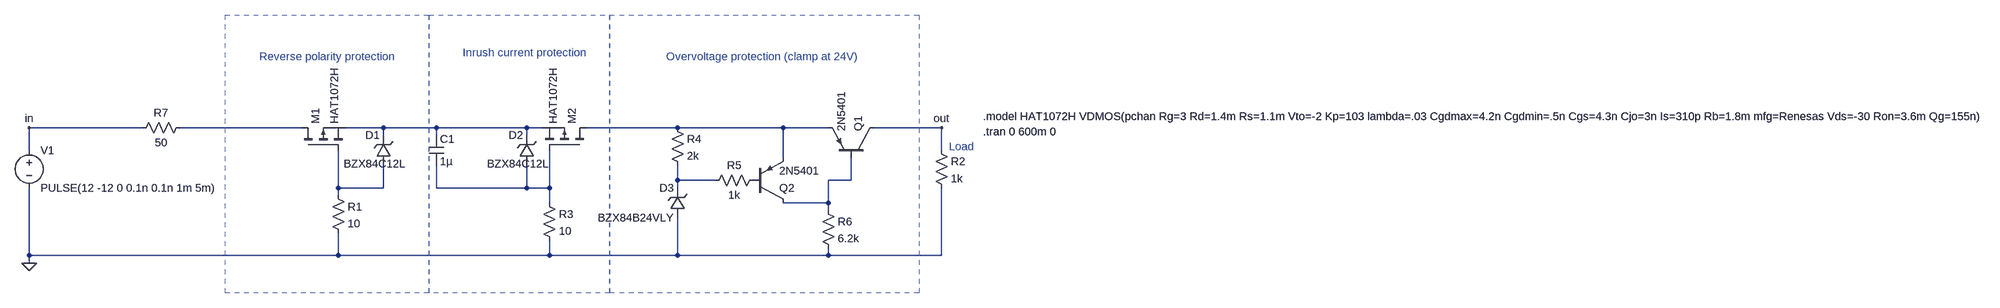
[diagram p0: schematic Protection.asc]
Protection.asc, the LTspice schematic file:
Version 4
SHEET 1 3788 740
WIRE -1088 144 -1328 144
WIRE -752 144 -1008 144
WIRE -576 144 -656 144
WIRE -464 144 -576 144
WIRE -272 144 -464 144
WIRE -240 144 -272 144
WIRE 48 144 -144 144
WIRE 272 144 48 144
WIRE 368 144 272 144
WIRE 608 144 464 144
WIRE -576 160 -576 144
WIRE -464 160 -464 144
WIRE -272 160 -272 144
WIRE -1328 192 -1328 144
WIRE 608 192 608 144
WIRE 272 208 272 144
WIRE 48 256 48 224
WIRE 128 256 48 256
WIRE 416 256 416 208
WIRE 416 256 368 256
WIRE -672 272 -672 192
WIRE -576 272 -576 224
WIRE -576 272 -672 272
WIRE -464 272 -464 224
WIRE -272 272 -272 224
WIRE -272 272 -464 272
WIRE -224 272 -224 192
WIRE -224 272 -272 272
WIRE 48 272 48 256
WIRE -672 288 -672 272
WIRE -224 304 -224 272
WIRE 368 304 368 256
WIRE 368 304 272 304
WIRE 368 320 368 304
WIRE -1328 416 -1328 272
WIRE -672 416 -672 368
WIRE -672 416 -1328 416
WIRE -224 416 -224 384
WIRE -224 416 -672 416
WIRE 48 416 48 336
WIRE 48 416 -224 416
WIRE 368 416 368 400
WIRE 368 416 48 416
WIRE 608 416 608 272
WIRE 608 416 368 416
WIRE -1328 432 -1328 416
FLAG -1328 432 0
FLAG -1328 144 in
FLAG 608 144 out
SYMBOL pmos -752 192 R270
SYMATTR InstName M1
SYMATTR Value HAT1072H
SYMBOL res -688 272 R0
SYMATTR InstName R1
SYMATTR Value 10
SYMBOL zener -560 224 R180
WINDOW 0 24 64 Left 2
WINDOW 3 -31 3 Left 2
SYMATTR InstName D1
SYMATTR Value BZX84C12L
SYMBOL pmos -144 192 M270
SYMATTR InstName M2
SYMATTR Value HAT1072H
SYMBOL res -240 288 R0
SYMATTR InstName R3
SYMATTR Value 10
SYMBOL cap -480 160 R0
SYMATTR InstName C1
SYMATTR Value 1µ
SYMBOL pnp 464 208 M270
SYMATTR InstName Q1
SYMATTR Value 2N5401
SYMBOL res 32 128 R0
SYMATTR InstName R4
SYMATTR Value 2k
SYMBOL zener 64 336 R180
WINDOW 0 24 64 Left 2
WINDOW 3 24 0 Left 2
SYMATTR InstName D3
SYMATTR Value BZX84B24VLY
SYMBOL res 224 240 R90
WINDOW 0 0 56 VBottom 2
WINDOW 3 32 56 VTop 2
SYMATTR InstName R5
SYMATTR Value 1k
SYMBOL res 352 304 R0
SYMATTR InstName R6
SYMATTR Value 6.2k
SYMBOL pnp 208 304 M180
SYMATTR InstName Q2
SYMATTR Value 2N5401
SYMBOL zener -256 224 R180
WINDOW 0 24 64 Left 2
WINDOW 3 -31 3 Left 2
SYMATTR InstName D2
SYMATTR Value BZX84C12L
SYMBOL res 592 176 R0
SYMATTR InstName R2
SYMATTR Value 1k
SYMBOL res -992 128 R90
WINDOW 0 0 56 VBottom 2
WINDOW 3 32 56 VTop 2
SYMATTR InstName R7
SYMATTR Value 50
SYMBOL voltage -1328 176 R0
WINDOW 123 0 0 Left 0
WINDOW 39 0 0 Left 0
SYMATTR InstName V1
SYMATTR Value PULSE(12 -12 0 0.1n 0.1n 1m 5m)
TEXT 696 120 Left 2 !.model HAT1072H VDMOS(pchan Rg=3 Rd=1.4m Rs=1.1m Vto=-2 Kp=103 lambda=.03 Cgdmax=4.2n Cgdmin=.5n Cgs=4.3n Cjo=3n Is=310p Rb=1.8m mfg=Renesas Vds=-30 Ron=3.6m Qg=155n)
TEXT 696 152 Left 2 !.tran 0 600m 0
TEXT -840 -8 Left 2 ;Reverse polarity protection
TEXT -408 -16 Left 2 ;Inrush current protection
TEXT 24 -8 Left 2 ;Overvoltage protection (clamp at 24V)
TEXT 624 184 Left 2 ;Load
RECTANGLE Normal -480 496 -912 -96 1
RECTANGLE Normal -96 496 -480 -96 1
RECTANGLE Normal 560 496 -96 -96 1

The netlist it stands for:
* Protection.asc
M1 N001 N006 N002 N002 HAT1072H
R1 N006 0 10
D1 N006 N002 BZX84C12L
M2 N003 N007 N002 N002 HAT1072H
R3 N007 0 10
C1 N002 N007 1µ
Q1 out N005 N003 0 2N5401
R4 N003 N004 2k
D3 0 N004 BZX84B24VLY
R5 P001 N004 1k
R6 N005 0 6.2k
Q2 N005 P001 N003 0 2N5401
D2 N007 N002 BZX84C12L
R2 out 0 1k
R7 N001 in 50
V1 in 0 PULSE(12 -12 0 0.1n 0.1n 1m 5m)
.model D D
.lib standard.dio
.model NPN NPN
.model PNP PNP
.lib standard.bjt
.model NMOS NMOS
.model PMOS PMOS
.lib standard.mos
.model HAT1072H VDMOS(pchan Rg=3 Rd=1.4m Rs=1.1m Vto=-2 Kp=103 lambda=.03 Cgdmax=4.2n Cgdmin=.5n Cgs=4.3n Cjo=3n Is=310p Rb=1.8m mfg=Renesas Vds=-30 Ron=3.6m Qg=155n)
.tran 0 600m 0
* Reverse polarity protection
* Inrush current protection
* Overvoltage protection (clamp at 24V)
* Load
.backanno
.end